# Altium schematic sheet Connector-Section.SchDoc
size A4; SheetNumber: 7
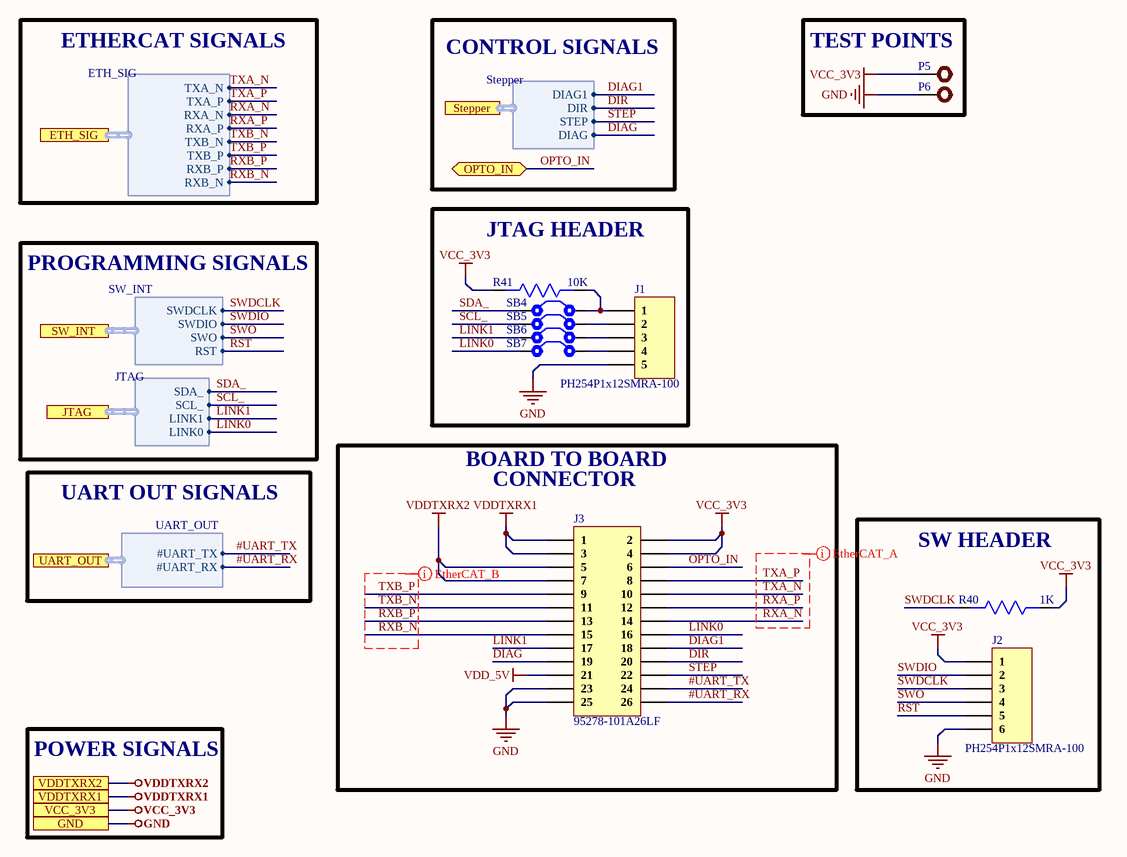
[diagram p0: Connector-Section.SchDoc]

## Parts
J1  PH254P1x12SMRA-100  [HDR1X5 SMD]
J2  PH254P1x12SMRA-100  [HDR1X6 SMD]
J3  95278-101A26LF  [95278-101A26LF]
P5  Test Point  [TEST POINT]  (value not drawn)
P6  Test Point  [TEST POINT]  (value not drawn)
R40  1K  [Res0603]
R41  10K  [Res0603]
SB4  Solder Bridge  [Solder Bridge]  (value not drawn)
SB5  Solder Bridge  [Solder Bridge]  (value not drawn)
SB6  Solder Bridge  [Solder Bridge]  (value not drawn)
SB7  Solder Bridge  [Solder Bridge]  (value not drawn)

## Blocks framed on the sheet
TEST POINTS: P5 P6
JTAG HEADER: J1 R41 SB4-SB7
SW HEADER: J2 R40

## Ports
ETH_SIG (harness ETH_SIG), GND, JTAG (harness JTAG), OPTO_IN (bidir), Stepper (harness Stepper), SW_INT (harness SW_INT), UART_OUT (harness UART_OUT), VCC_3V3, VDDTXRX1, VDDTXRX2

## Harnesses
SW_INT: SWDCLK, SWDIO, SWO, RST
JTAG: SDA_, SCL_, LINK1, LINK0
ETH_SIG: TXA_N, TXA_P, RXA_N, RXA_P, TXB_N, TXB_P, RXB_P, RXB_N
Stepper: DIAG1, DIR, STEP, DIAG
UART_OUT: #UART_TX, #UART_RX

## Nets
GND: J1.5 J2.6 J3.23 J3.25 P6.1 ; port GND
VCC_3V3: J2.1 J3.2 J3.4 P5.1 R40.1 R41.2 ; port VCC_3V3
VDD_5V: J3.21
VDDTXRX1: J3.1 J3.3 ; port VDDTXRX1
VDDTXRX2: J3.5 J3.7 ; port VDDTXRX2
#UART_RX: J3.26 ; port UART_OUT.#UART_RX
#UART_TX: J3.24 ; port UART_OUT.#UART_TX
DIAG: J3.19 ; port Stepper.DIAG
DIAG1: J3.18 ; port Stepper.DIAG1
DIR: J3.20 ; port Stepper.DIR
LINK0: J3.16 SB7.1 ; port JTAG.LINK0
LINK1: J3.17 SB6.1 ; port JTAG.LINK1
OPTO_IN: J3.6 ; port OPTO_IN
RST: J2.5 ; port SW_INT.RST
RXA_N: J3.14 ; port ETH_SIG.RXA_N
RXA_P: J3.12 ; port ETH_SIG.RXA_P
RXB_N: J3.15 ; port ETH_SIG.RXB_N
RXB_P: J3.13 ; port ETH_SIG.RXB_P
SCL_: SB5.1 ; port JTAG.SCL_
SDA_: SB4.1 ; port JTAG.SDA_
STEP: J3.22 ; port Stepper.STEP
SWDCLK: J2.3 R40.2 ; port SW_INT.SWDCLK
SWDIO: J2.2 ; port SW_INT.SWDIO
SWO: J2.4 ; port SW_INT.SWO
TXA_N: J3.10 ; port ETH_SIG.TXA_N
TXA_P: J3.8 ; port ETH_SIG.TXA_P
TXB_N: J3.11 ; port ETH_SIG.TXB_N
TXB_P: J3.9 ; port ETH_SIG.TXB_P
NetJ1_1: J1.1 R41.1 SB4.2
NetJ1_2: J1.2 SB5.2
NetJ1_3: J1.3 SB6.2
NetJ1_4: J1.4 SB7.2

## Layout directives
differential pair; differential pair class EtherCAT_A_Lines; net class EtherCAT_A; rule Matched Net Lengths [Tolerance = 25.4mil]; rule Impedance Constraint [Min = 85.00    Max = 95.00    ]: RXA_N, RXA_P, TXA_N, TXA_P
differential pair; differential pair class EtherCAT_B_Lines; net class EtherCAT_B; rule Matched Net Lengths [Tolerance = 25.4mil]; rule Impedance Constraint [Min = 85.00    Max = 95.00    ]: RXB_N, RXB_P, TXB_N, TXB_P

## Notes on the sheet
- ETHERCAT SIGNALS
- CONTROL SIGNALS
- PROGRAMMING SIGNALS
- BOARD TO BOARD
- UART OUT SIGNALS
- (near J3) CONNECTOR
- POWER SIGNALS

## Library data of the parts
J1 = PH254P1x12SMRA-100: 5 POS 2.54mm Pin Header Male single row Right Angle SMD; Manufacturer: RTLECS; Pin shape: Square pin; Pitch: 2.54
J2 = PH254P1x12SMRA-100_1: 6 POS 2.54mm Pin Header Male single row Right Angle SMD; Manufacturer: RTLECS; Pin shape: Square pin; Pitch: 2.54
J3 = 95278-101A26LF: CONN HEADER SMD 26POS 2.54MM; Manufacturer: Amphenol ICC (FCI); Manufacturer Part No:: 95278-101A26LF; Package: Custom; ComponentLink1Description: New link; ComponentLink1URL: https://www.digikey.com/en/products/detail/amphenol-icc-fci/95278-101A26LF/1488594
P5 P6 = TEST POINT: Test Point ON
R40 = RC0603FR-071KL: RES SMD 1K OHM 1% 1/10W 0603; Manufacturer: Yageo; Resistance: 1kR; Temperature Coefficient: 100ppm/°C; Power Rating: 100mW; Voltage Rating: 50V; ComponentLink1URL: https://www.verical.com/server-webapp/html/getDatasheet?partID=409289&src-supplier=Verical; ComponentLink1Description: https://www.verical.com/server-webapp/html/getDatasheet?partID=409289&src-supplier=Verical; Supplier 1: Digi-Key; Manufacturer Part Number: RC0603FR-071KL; Stock 1: 21472395; Pricing 1: 1=0.1, 10=0.023, 100=0.0094, 1000=0.0042, 2500=0.0037 (USD); Case/Package: 0603; Contact Plating: Tin,Matte; Case Code (Imperial): 0603; Case Code (Metric): 1608; Min Operating Temperature: -55°C; Max Operating Temperature: 155°C; Tolerance: 1%; Composition: Thick Film; Packaging: Tape and Reel; Termination: SMD/SMT; Military Standard: Not; Length: 1.6mm; Height: 0.45mm; Depth: 0.8mm; Radiation Hardening: No; REACH SVHC: No SVHC; Lead Free: Lead Free; ComponentLink2URL: http://documents.rs-components.com/techlib://itc_doclist_GB.htm?stockno=5048928&src-supplier=RSComponents; ComponentLink2Description: http://documents.rs-components.com/techlib://itc_doclist_GB.htm?stockno=5048928&src-supplier=RSComponents; ComponentLink3URL: http://www.yageo.com/documents/recent/PYu-RC0603_51_RoHS_L_4.pdf?src-supplier=Avnet+Europe; ComponentLink3Description: http://www.yageo.com/documents/recent/PYu-RC0603_51_RoHS_L_4.pdf?src-supplier=Avnet+Europe; ComponentLink4URL: http://www.farnell.com/datasheets/2167052.pdf?src-supplier=Element14; ComponentLink4Description: http://www.farnell.com/datasheets/2167052.pdf?src-supplier=Element14; ComponentLink5URL: http://www.farnell.com/datasheets/1868787.pdf?src-supplier=Element14; ComponentLink5Description: http://www.farnell.com/datasheets/1868787.pdf?src-supplier=Element14; ComponentLink6URL: http://www.yageo.com/documents/recent/PYu-RC_Group_51_RoHS_L_2.pdf?src-supplier=Avnet; ComponentLink6Description: http://www.yageo.com/documents/recent/PYu-RC_Group_51_RoHS_L_2.pdf?src-supplier=Avnet; ComponentLink7URL: https://www.verical.com/server-webapp/html/getDatasheet?partID=404327&src-supplier=Verical; ComponentLink7Description: https://www.verical.com/server-webapp/html/getDatasheet?partID=404327&src-supplier=Verical; ComponentLink8URL: http://www.farnell.com/datasheets/443971.pdf?src-supplier=Element14; ComponentLink8Description: http://www.farnell.com/datasheets/443971.pdf?src-supplier=Element14; Supplier Part Number 1: 311-1.00KHRDKR-ND
R41 = AC0603JR-0710KL: RES SMD 10K OHM 5% 1/10W 0603; Manufacturer: Yageo; Voltage Rating: 50V; Resistance: 10kR; Power Rating: 100mW; Temperature Coefficient: 100ppm/°C; Supplier 1: Future Electronics; Manufacturer Part Number: AC0603JR-0710KL; RoHS: Yes; Category: Chip SMD Resistors; Stock 1: 1533000; Pricing 1: 5000=0.00540 (USD); Case/Package: 0603; Case Code (Imperial): 0603; Case Code (Metric): 1608; Size Code: 0603; Min Operating Temperature: -55°C; Max Operating Temperature: 155°C; Packaging: Tape and Reel; Tolerance: 5%; Package Quantity: 1; Resistor Type: Thick Film; Termination: SMD/SMT; Number of Terminations: 2; Max Power Dissipation: 100mW; Features: Moisture Resistant,Automotive AEC-Q200,Anti-Sulfur; Series: AC; Construction: Rectangular; Length: 0.063inch; Width: 0.031inch; Height: 0.022inch; Depth: 0.8mm; Military Standard: Not; Lead Free: Lead Free; RoHS Compliant: Yes; ComponentLink1URL: https://datasheet.ciiva.com/5562/pyu-ac-51-rohs-l-2-5562553.pdf?src-supplier=Mouser; ComponentLink1Description: https://datasheet.ciiva.com/5562/pyu-ac-51-rohs-l-2-5562553.pdf?src-supplier=Mouser; Supplier Part Number 1: 1029044
SB4-SB7 = Solder Bridge: Solder Bridge ON